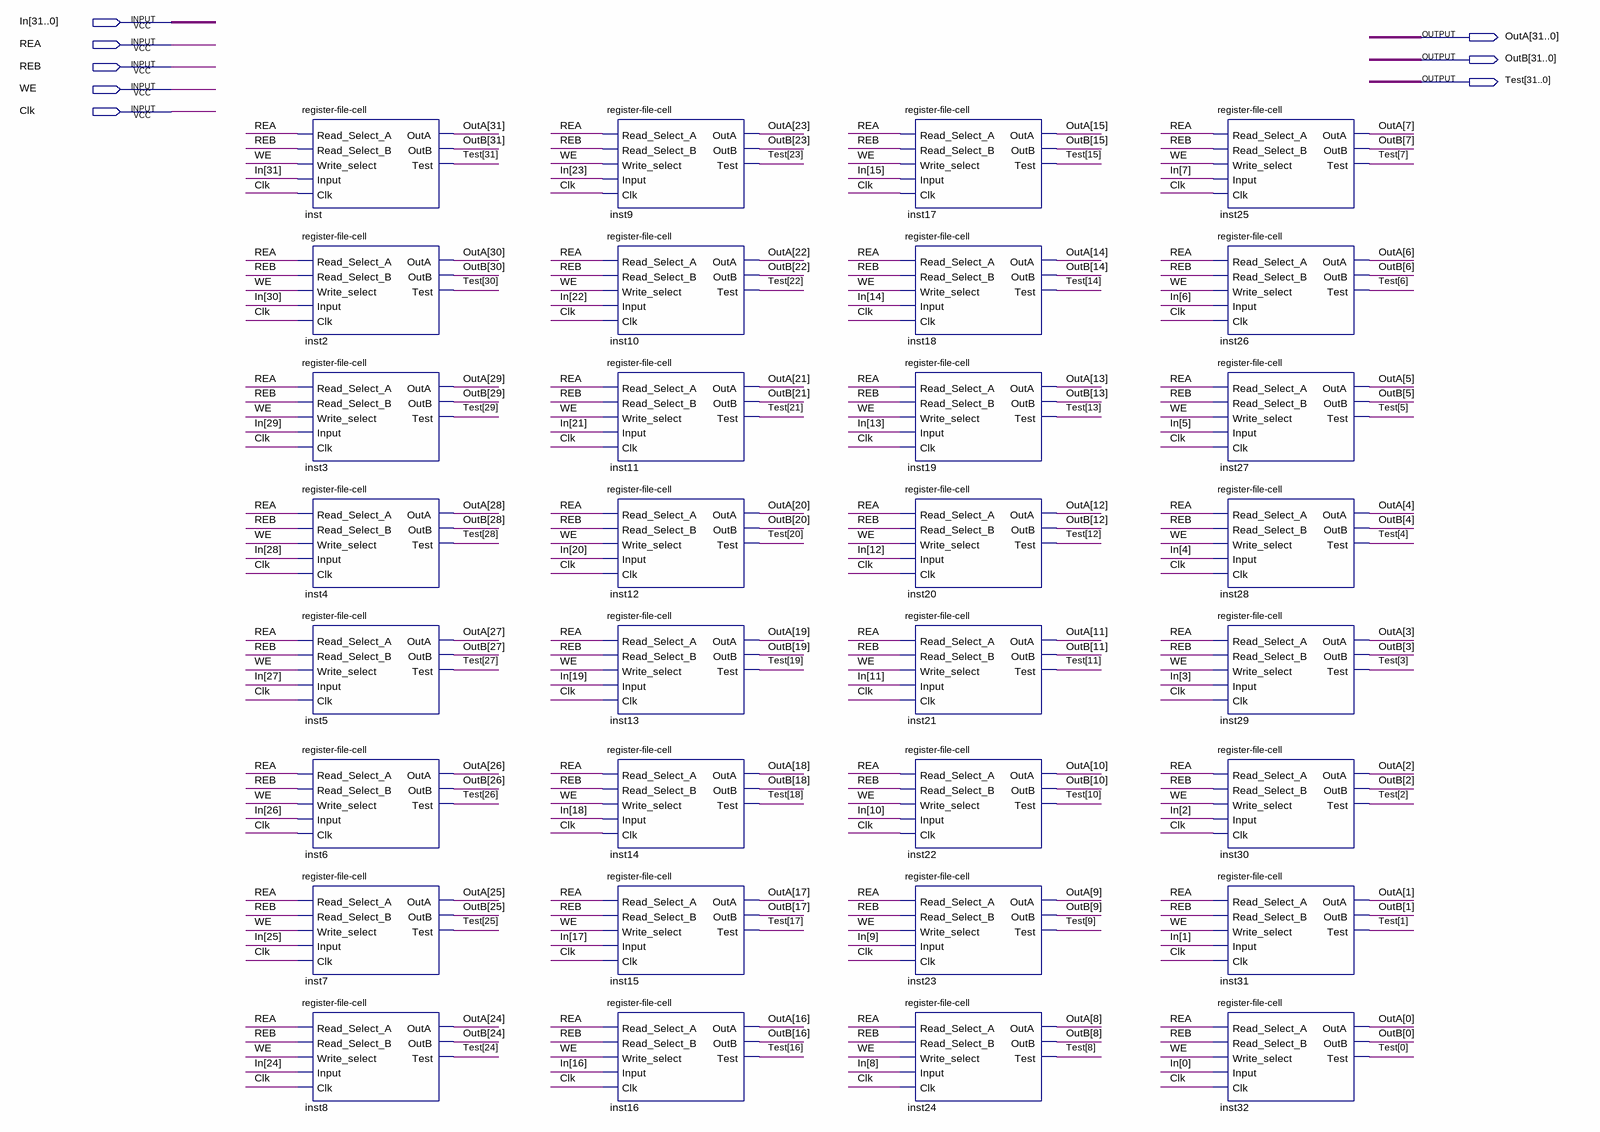
[diagram p0: schematic sheet]
// Quartus schematic register_32_bit.bdf as structural Verilog: 32 symbols, 8 pins
module register_32_bit (
  input  [31:0] In,
  input  REA,
  input  REB,
  input  WE,
  input  Clk,
  output [31:0] OutA,
  output [31:0] OutB,
  output [31:0] Test
);

  \register-file-cell  inst (
    .Read_Select_A(REA), .Read_Select_B(REB), .Write_select(WE), .Input(In[31]), .Clk(Clk), .OutA(OutA[31]),
    .OutB(OutB[31]), .Test(Test[31]));
  \register-file-cell  inst2 (
    .Read_Select_A(REA), .Read_Select_B(REB), .Write_select(WE), .Input(In[30]), .Clk(Clk), .OutA(OutA[30]),
    .OutB(OutB[30]), .Test(Test[30]));
  \register-file-cell  inst3 (
    .Read_Select_A(REA), .Read_Select_B(REB), .Write_select(WE), .Input(In[29]), .Clk(Clk), .OutA(OutA[29]),
    .OutB(OutB[29]), .Test(Test[29]));
  \register-file-cell  inst4 (
    .Read_Select_A(REA), .Read_Select_B(REB), .Write_select(WE), .Input(In[28]), .Clk(Clk), .OutA(OutA[28]),
    .OutB(OutB[28]), .Test(Test[28]));
  \register-file-cell  inst5 (
    .Read_Select_A(REA), .Read_Select_B(REB), .Write_select(WE), .Input(In[27]), .Clk(Clk), .OutA(OutA[27]),
    .OutB(OutB[27]), .Test(Test[27]));
  \register-file-cell  inst6 (
    .Read_Select_A(REA), .Read_Select_B(REB), .Write_select(WE), .Input(In[26]), .Clk(Clk), .OutA(OutA[26]),
    .OutB(OutB[26]), .Test(Test[26]));
  \register-file-cell  inst7 (
    .Read_Select_A(REA), .Read_Select_B(REB), .Write_select(WE), .Input(In[25]), .Clk(Clk), .OutA(OutA[25]),
    .OutB(OutB[25]), .Test(Test[25]));
  \register-file-cell  inst8 (
    .Read_Select_A(REA), .Read_Select_B(REB), .Write_select(WE), .Input(In[24]), .Clk(Clk), .OutA(OutA[24]),
    .OutB(OutB[24]), .Test(Test[24]));
  \register-file-cell  inst9 (
    .Read_Select_A(REA), .Read_Select_B(REB), .Write_select(WE), .Input(In[23]), .Clk(Clk), .OutA(OutA[23]),
    .OutB(OutB[23]), .Test(Test[23]));
  \register-file-cell  inst10 (
    .Read_Select_A(REA), .Read_Select_B(REB), .Write_select(WE), .Input(In[22]), .Clk(Clk), .OutA(OutA[22]),
    .OutB(OutB[22]), .Test(Test[22]));
  \register-file-cell  inst11 (
    .Read_Select_A(REA), .Read_Select_B(REB), .Write_select(WE), .Input(In[21]), .Clk(Clk), .OutA(OutA[21]),
    .OutB(OutB[21]), .Test(Test[21]));
  \register-file-cell  inst12 (
    .Read_Select_A(REA), .Read_Select_B(REB), .Write_select(WE), .Input(In[20]), .Clk(Clk), .OutA(OutA[20]),
    .OutB(OutB[20]), .Test(Test[20]));
  \register-file-cell  inst13 (
    .Read_Select_A(REA), .Read_Select_B(REB), .Write_select(WE), .Input(In[19]), .Clk(Clk), .OutA(OutA[19]),
    .OutB(OutB[19]), .Test(Test[19]));
  \register-file-cell  inst14 (
    .Read_Select_A(REA), .Read_Select_B(REB), .Write_select(WE), .Input(In[18]), .Clk(Clk), .OutA(OutA[18]),
    .OutB(OutB[18]), .Test(Test[18]));
  \register-file-cell  inst15 (
    .Read_Select_A(REA), .Read_Select_B(REB), .Write_select(WE), .Input(In[17]), .Clk(Clk), .OutA(OutA[17]),
    .OutB(OutB[17]), .Test(Test[17]));
  \register-file-cell  inst16 (
    .Read_Select_A(REA), .Read_Select_B(REB), .Write_select(WE), .Input(In[16]), .Clk(Clk), .OutA(OutA[16]),
    .OutB(OutB[16]), .Test(Test[16]));
  \register-file-cell  inst17 (
    .Read_Select_A(REA), .Read_Select_B(REB), .Write_select(WE), .Input(In[15]), .Clk(Clk), .OutA(OutA[15]),
    .OutB(OutB[15]), .Test(Test[15]));
  \register-file-cell  inst18 (
    .Read_Select_A(REA), .Read_Select_B(REB), .Write_select(WE), .Input(In[14]), .Clk(Clk), .OutA(OutA[14]),
    .OutB(OutB[14]), .Test(Test[14]));
  \register-file-cell  inst19 (
    .Read_Select_A(REA), .Read_Select_B(REB), .Write_select(WE), .Input(In[13]), .Clk(Clk), .OutA(OutA[13]),
    .OutB(OutB[13]), .Test(Test[13]));
  \register-file-cell  inst20 (
    .Read_Select_A(REA), .Read_Select_B(REB), .Write_select(WE), .Input(In[12]), .Clk(Clk), .OutA(OutA[12]),
    .OutB(OutB[12]), .Test(Test[12]));
  \register-file-cell  inst21 (
    .Read_Select_A(REA), .Read_Select_B(REB), .Write_select(WE), .Input(In[11]), .Clk(Clk), .OutA(OutA[11]),
    .OutB(OutB[11]), .Test(Test[11]));
  \register-file-cell  inst22 (
    .Read_Select_A(REA), .Read_Select_B(REB), .Write_select(WE), .Input(In[10]), .Clk(Clk), .OutA(OutA[10]),
    .OutB(OutB[10]), .Test(Test[10]));
  \register-file-cell  inst23 (
    .Read_Select_A(REA), .Read_Select_B(REB), .Write_select(WE), .Input(In[9]), .Clk(Clk), .OutA(OutA[9]),
    .OutB(OutB[9]), .Test(Test[9]));
  \register-file-cell  inst24 (
    .Read_Select_A(REA), .Read_Select_B(REB), .Write_select(WE), .Input(In[8]), .Clk(Clk), .OutA(OutA[8]),
    .OutB(OutB[8]), .Test(Test[8]));
  \register-file-cell  inst25 (
    .Read_Select_A(REA), .Read_Select_B(REB), .Write_select(WE), .Input(In[7]), .Clk(Clk), .OutA(OutA[7]),
    .OutB(OutB[7]), .Test(Test[7]));
  \register-file-cell  inst26 (
    .Read_Select_A(REA), .Read_Select_B(REB), .Write_select(WE), .Input(In[6]), .Clk(Clk), .OutA(OutA[6]),
    .OutB(OutB[6]), .Test(Test[6]));
  \register-file-cell  inst27 (
    .Read_Select_A(REA), .Read_Select_B(REB), .Write_select(WE), .Input(In[5]), .Clk(Clk), .OutA(OutA[5]),
    .OutB(OutB[5]), .Test(Test[5]));
  \register-file-cell  inst28 (
    .Read_Select_A(REA), .Read_Select_B(REB), .Write_select(WE), .Input(In[4]), .Clk(Clk), .OutA(OutA[4]),
    .OutB(OutB[4]), .Test(Test[4]));
  \register-file-cell  inst29 (
    .Read_Select_A(REA), .Read_Select_B(REB), .Write_select(WE), .Input(In[3]), .Clk(Clk), .OutA(OutA[3]),
    .OutB(OutB[3]), .Test(Test[3]));
  \register-file-cell  inst30 (
    .Read_Select_A(REA), .Read_Select_B(REB), .Write_select(WE), .Input(In[2]), .Clk(Clk), .OutA(OutA[2]),
    .OutB(OutB[2]), .Test(Test[2]));
  \register-file-cell  inst31 (
    .Read_Select_A(REA), .Read_Select_B(REB), .Write_select(WE), .Input(In[1]), .Clk(Clk), .OutA(OutA[1]),
    .OutB(OutB[1]), .Test(Test[1]));
  \register-file-cell  inst32 (
    .Read_Select_A(REA), .Read_Select_B(REB), .Write_select(WE), .Input(In[0]), .Clk(Clk), .OutA(OutA[0]),
    .OutB(OutB[0]), .Test(Test[0]));
endmodule
